# Altium project 一体板.PrjPcb
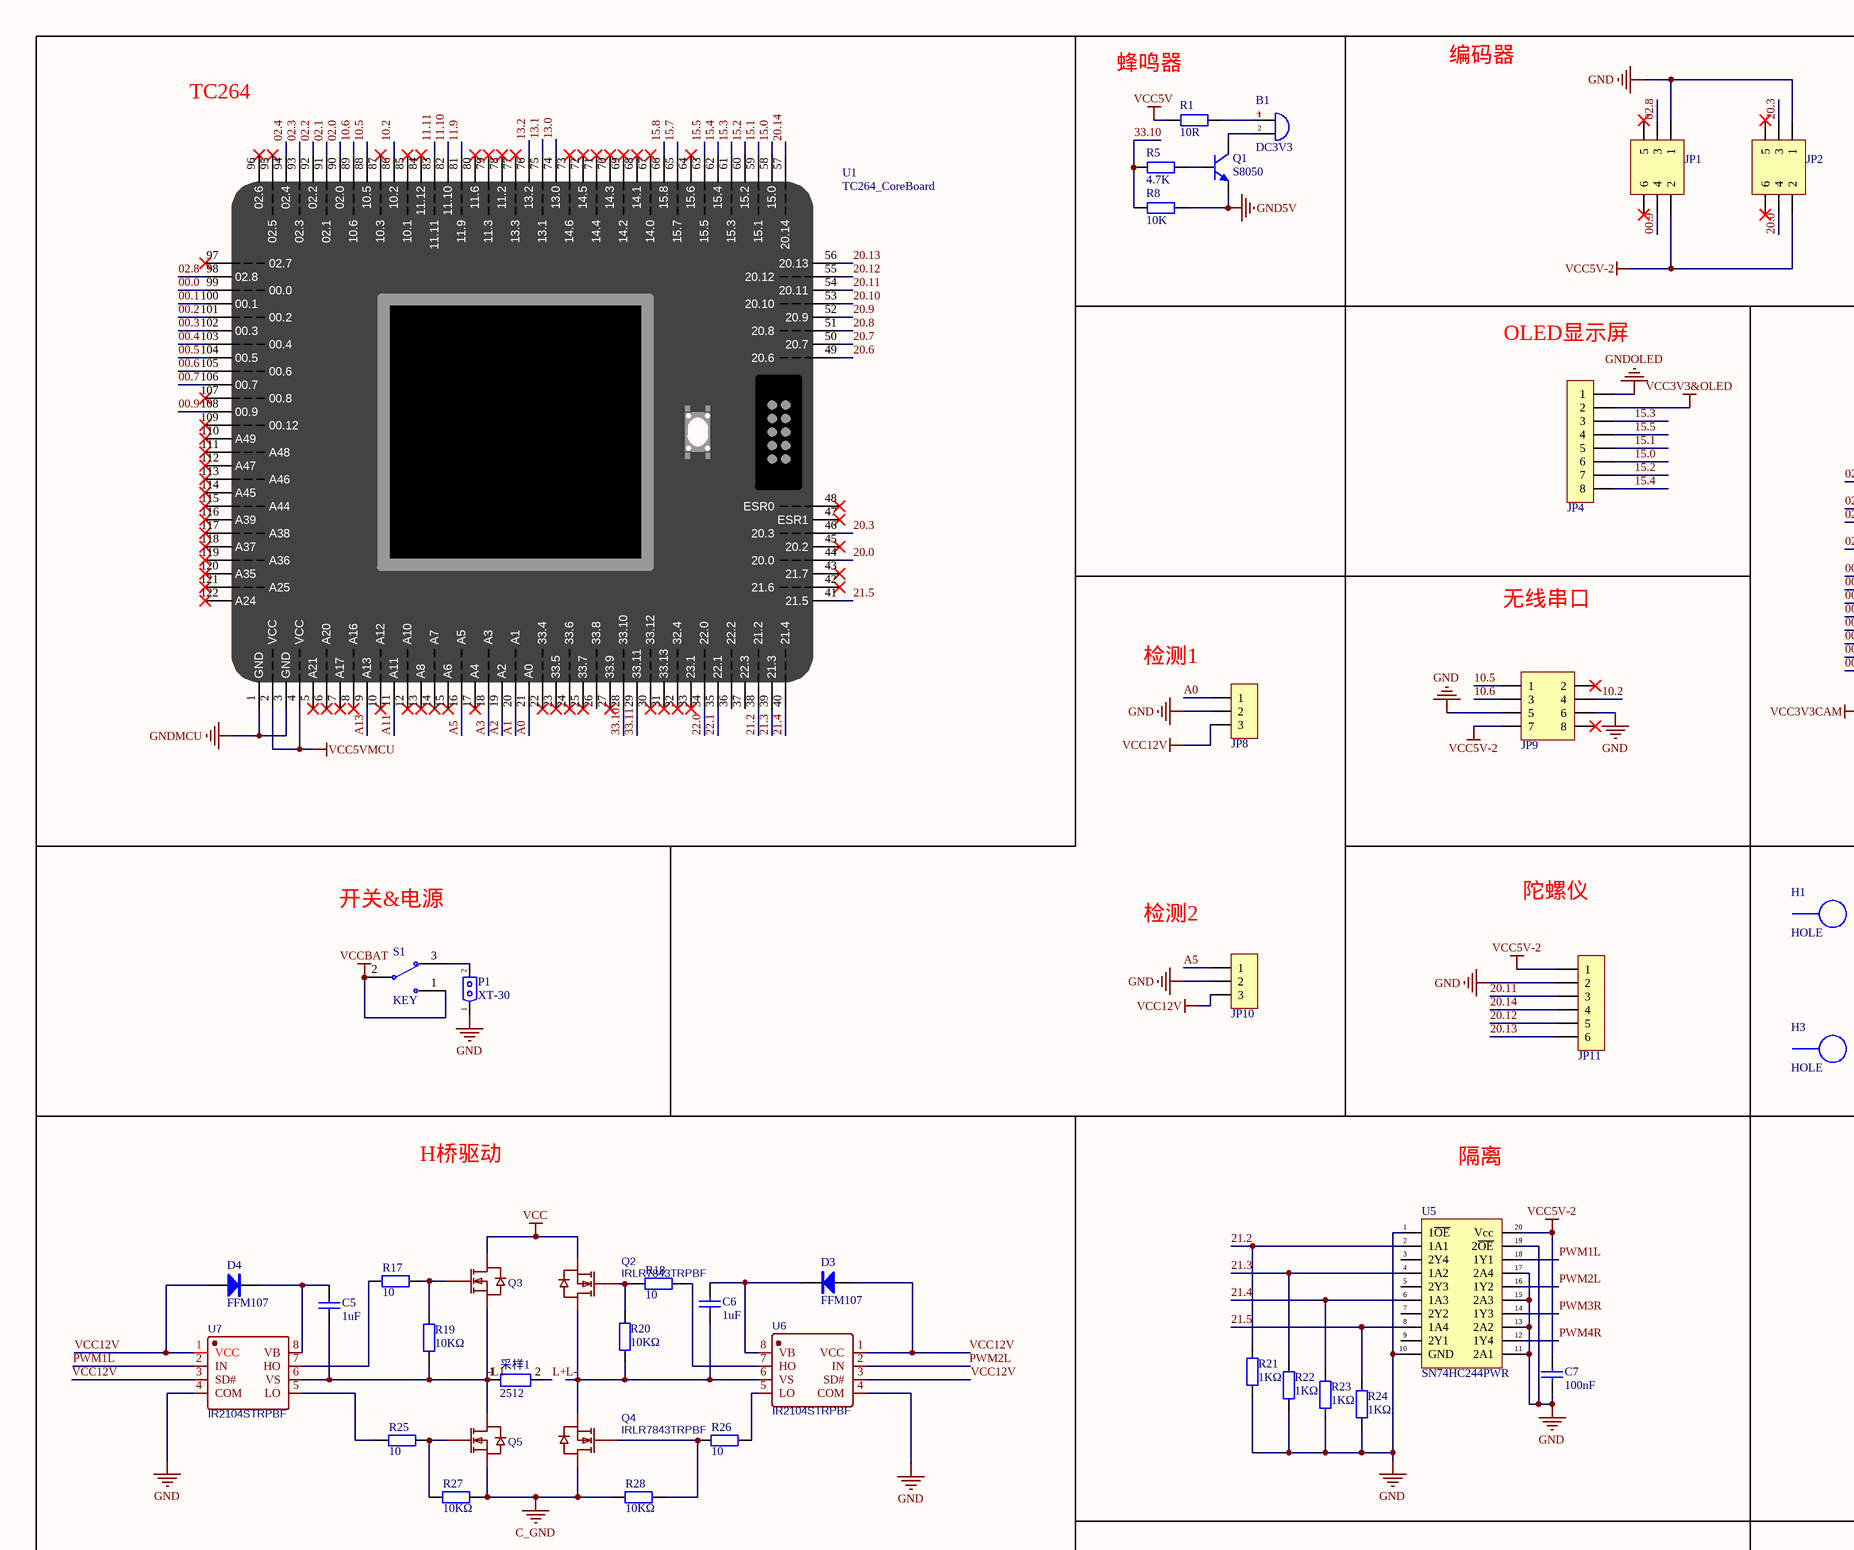
[diagram p0: 一体板.SchDoc, top left]
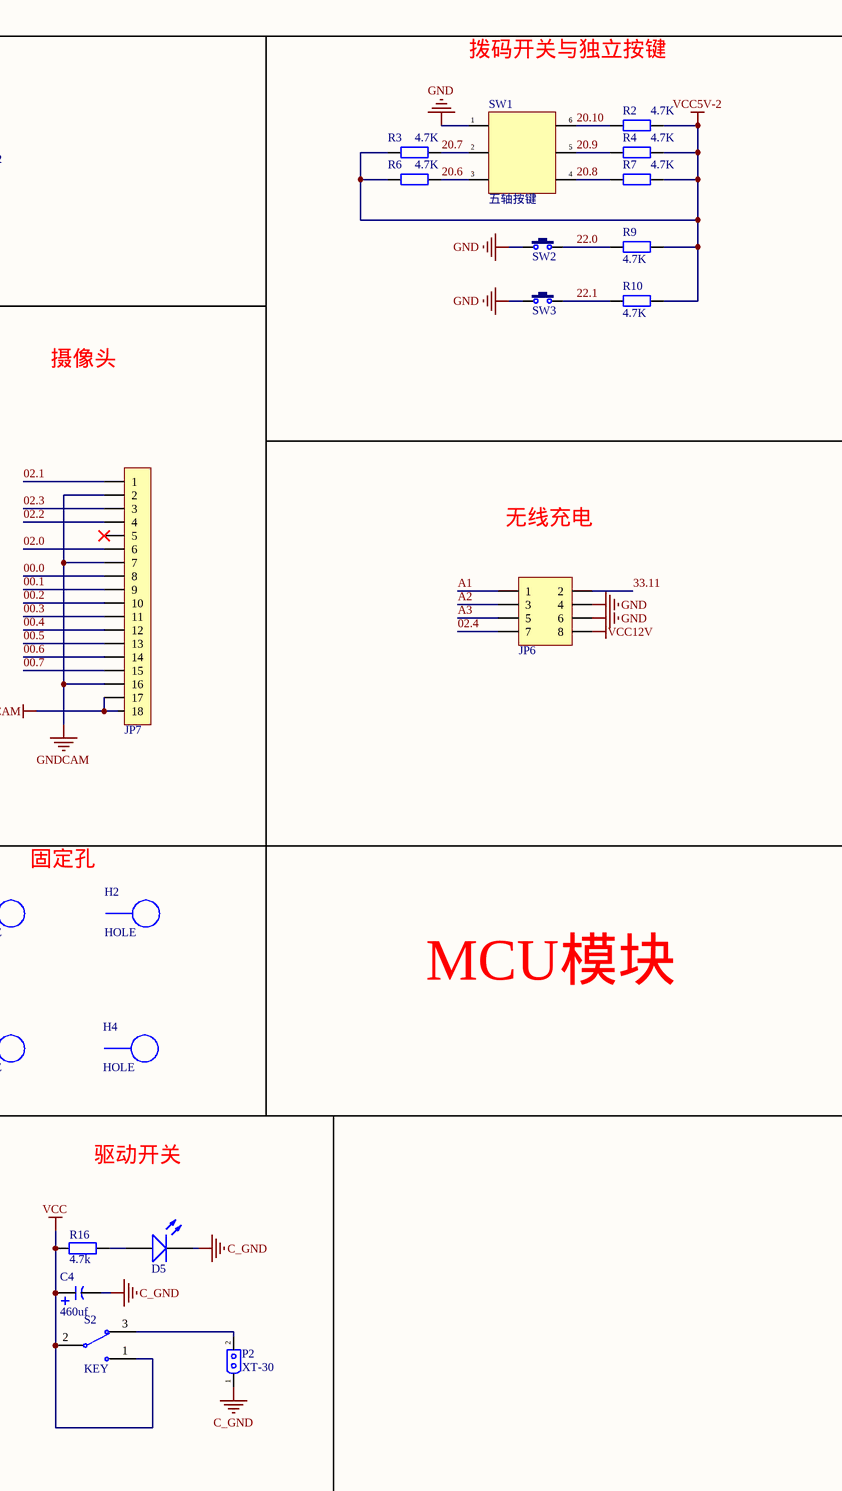
[diagram p1: 一体板.SchDoc, top middle]
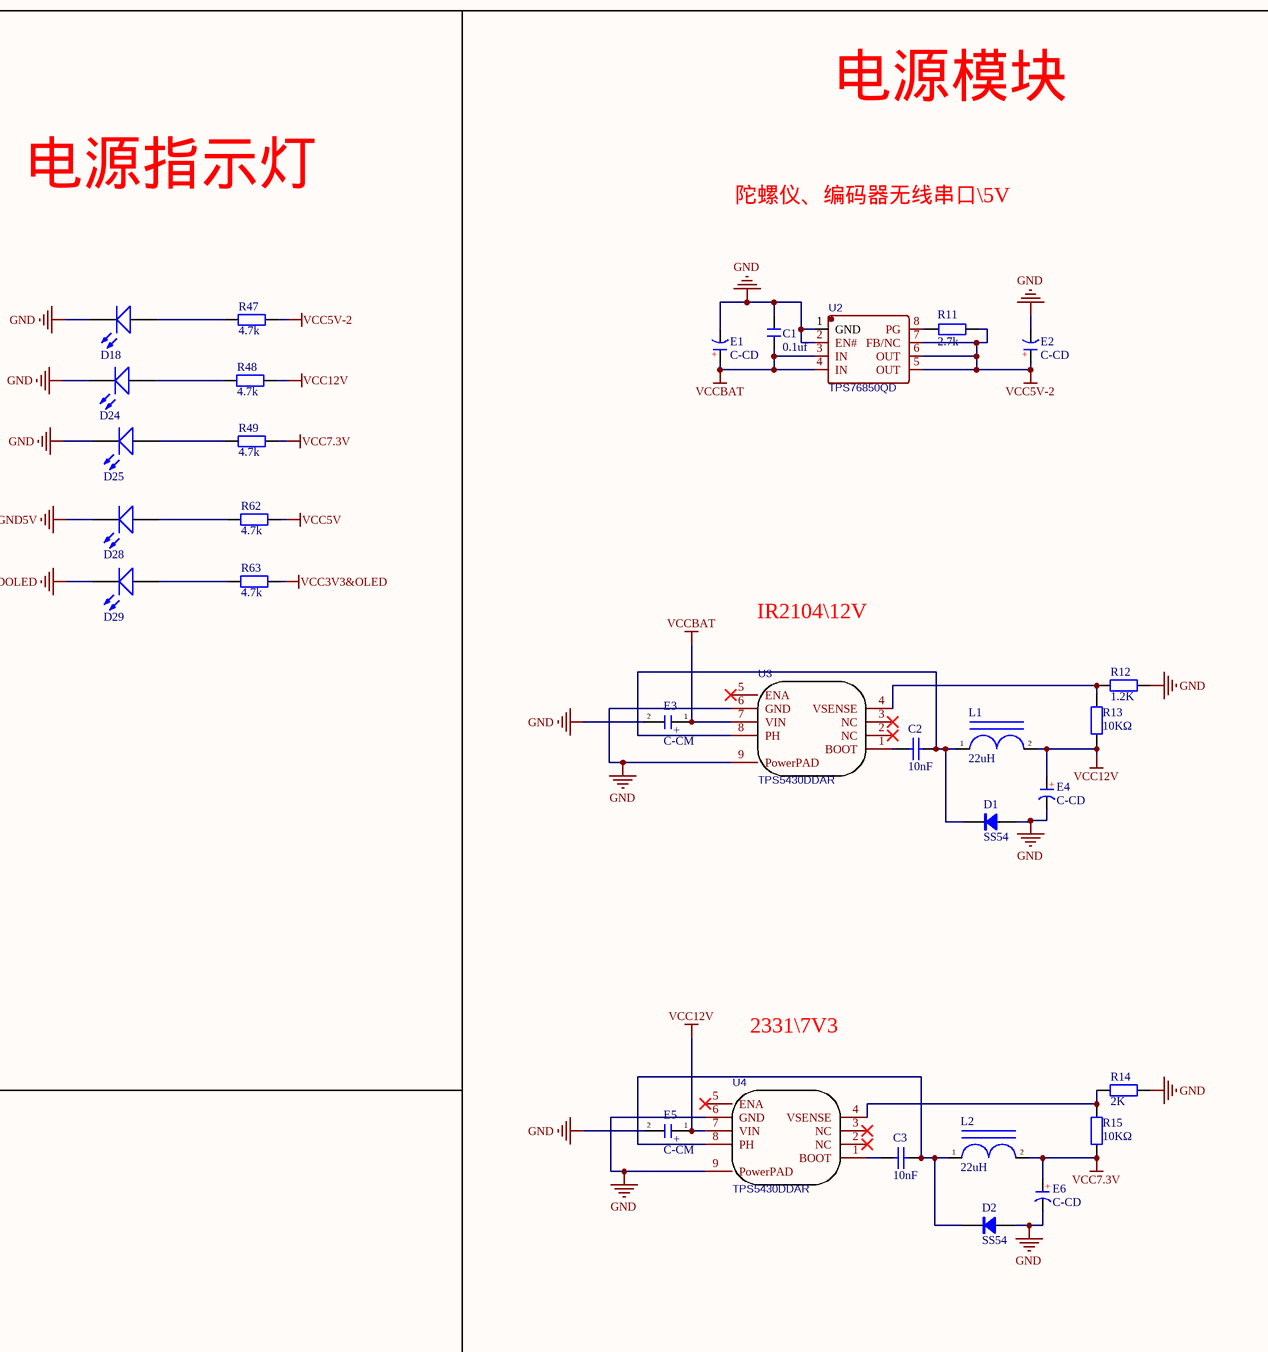
[diagram p2: 一体板.SchDoc, top right]
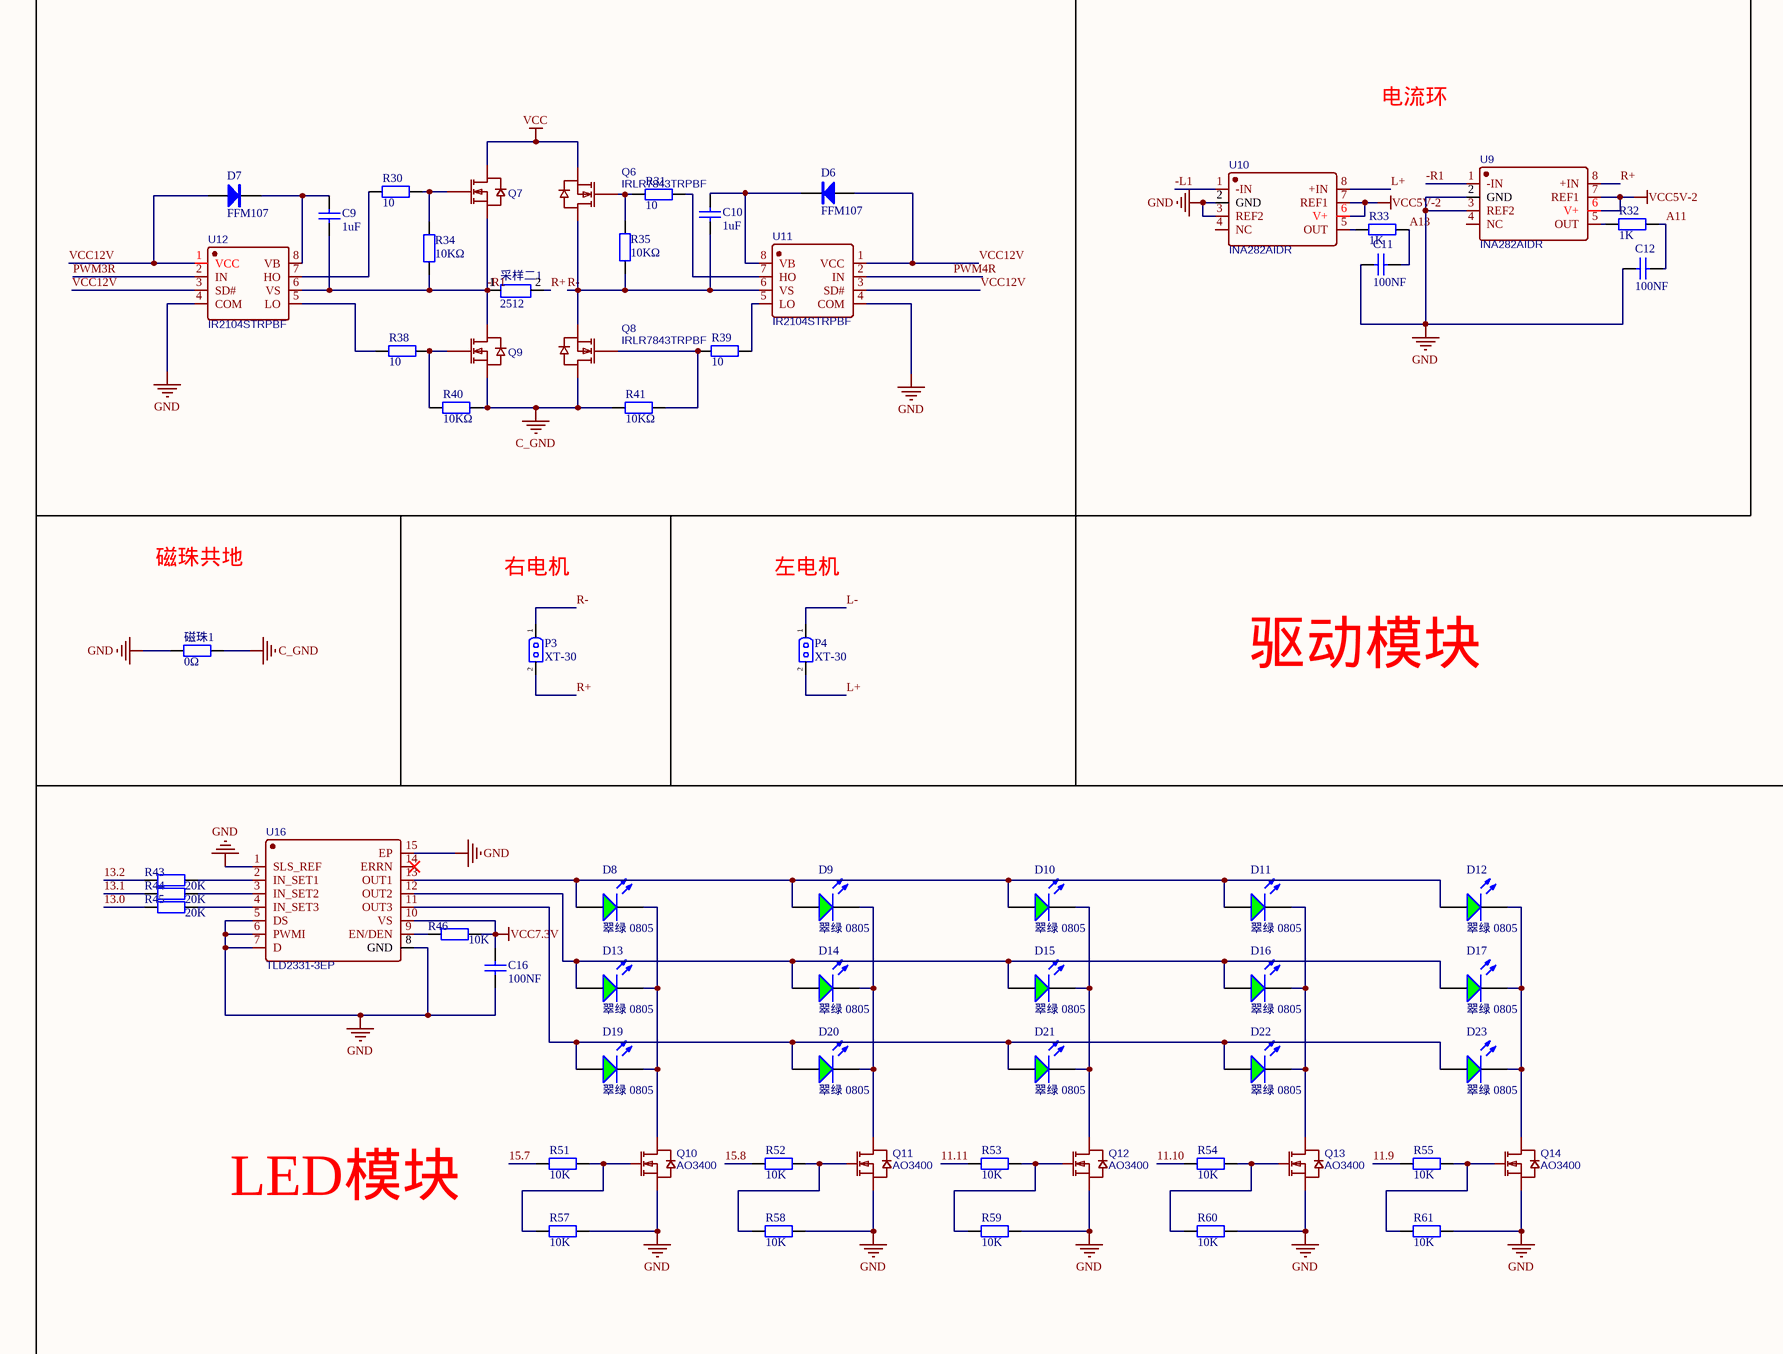
[diagram p3: 一体板.SchDoc, bottom left]
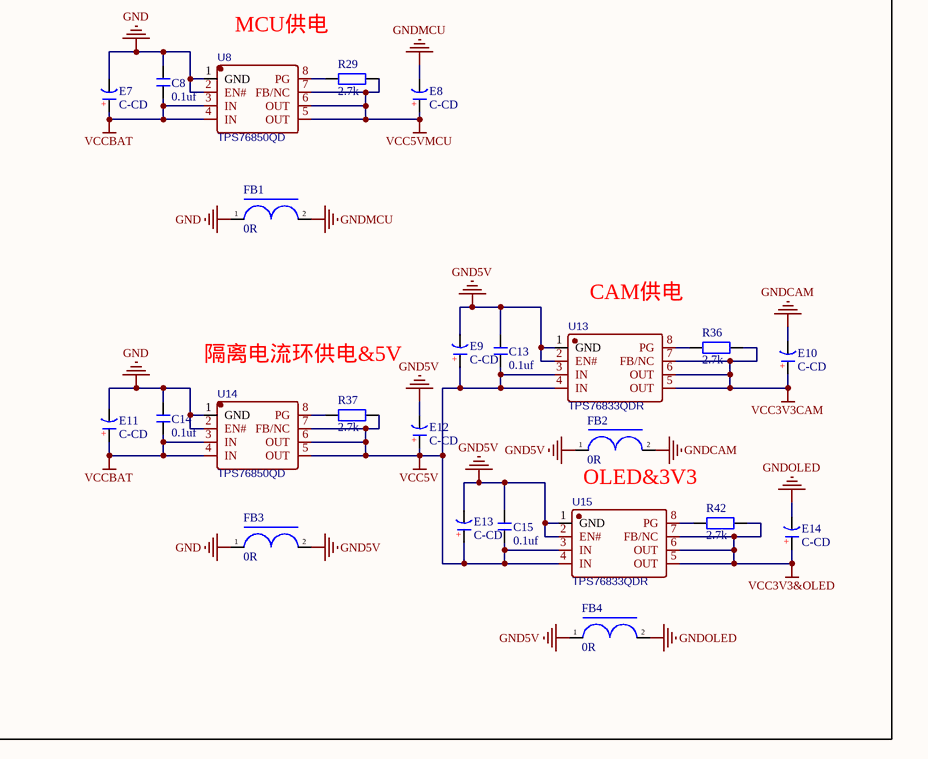
[diagram p4: 一体板.SchDoc, bottom right]
1 sheet, 180 parts. Net scope: global (net labels, ports and power ports of the same name join across sheets).

## Sheet 一体板.SchDoc
size A1; SheetNumber: 1; SheetTotal: 1

### Parts
B1  DC3V3  [BEEP 5x9x5.5]
C1  0.1uf  [C 0603_M]
C2  10nF  [0603_C]
C3  10nF  [0603_C]
C4  460uf  [铝电解]
C5  1uF  [0603_C]
C6  1uF  [0603_C]
C7  100nF  [0603_C]
C8  0.1uf  [C 0603_M]
C9  1uF  [0603_C]
C10  1uF  [0603_C]
C11  100NF  [0603_C]
C12  100NF  [0603_C]
C13  0.1uf  [C 0603_M]
C14  0.1uf  [C 0603_M]
C15  0.1uf  [C 0603_M]
C16  100NF  [0603_C]
D1  SS54  [SMA]
D2  SS54  [SMA]
D3  FFM107  [SOD-123]
D4  FFM107  [SOD-123]
D5  白灯 0603  [0603_LED_S1]  (value not drawn)
D6  FFM107  [SOD-123]
D7  FFM107  [SOD-123]
D8  翠绿 0805  [0805_LED_S1]
D9  翠绿 0805  [0805_LED_S1]
D10  翠绿 0805  [0805_LED_S1]
D11  翠绿 0805  [0805_LED_S1]
D12  翠绿 0805  [0805_LED_S1]
D13  翠绿 0805  [0805_LED_S1]
D14  翠绿 0805  [0805_LED_S1]
D15  翠绿 0805  [0805_LED_S1]
D16  翠绿 0805  [0805_LED_S1]
D17  翠绿 0805  [0805_LED_S1]
D18  白灯 0603  [0603_LED_S1]  (value not drawn)
D19  翠绿 0805  [0805_LED_S1]
D20  翠绿 0805  [0805_LED_S1]
D21  翠绿 0805  [0805_LED_S1]
D22  翠绿 0805  [0805_LED_S1]
D23  翠绿 0805  [0805_LED_S1]
D24  白灯 0603  [0603_LED_S1]  (value not drawn)
D25  白灯 0603  [0603_LED_S1]  (value not drawn)
D28  白灯 0603  [0603_LED_S1]  (value not drawn)
D29  白灯 0603  [0603_LED_S1]  (value not drawn)
E1  C-CD  [CD A(3216)]
E2  C-CD  [CD A(3216)]
E3  C-CM  [CT 6*6 - C]
E4  C-CD  [CD D(7343)]
E5  C-CM  [CT 6*6 - C]
E6  C-CD  [CD D(7343)]
E7  C-CD  [CD A(3216)]
E8  C-CD  [CD A(3216)]
E9  C-CD  [CD A(3216)]
E10  C-CD  [CD A(3216)]
E11  C-CD  [CD A(3216)]
E12  C-CD  [CD A(3216)]
E13  C-CD  [CD A(3216)]
E14  C-CD  [CD A(3216)]
FB1  0R  [FB 0805_M]
FB2  0R  [FB 0805_M]
FB3  0R  [FB 0805_M]
FB4  0R  [FB 0805_M]
H1  HOLE  [LQ_SCROW3&5MM]
H2  HOLE  [LQ_SCROW3&5MM]
H3  HOLE  [LQ_SCROW3&5MM]
H4  HOLE  [LQ_SCROW3&5MM]
JP1  Header3X2  [HDR2.54-LI-2x3P]  (value not drawn)
JP2  Header3X2  [HDR2.54-LI-2x3P]  (value not drawn)
JP4  HDR-1X8  [HDR2.54-LI-8P]  (value not drawn)
JP6  Header 4X2  [CONN-TH_A2006WV-2X4P]  (value not drawn)
JP7  FPC1.0-18P  [FPC0.5 2H-WS-18P]  (value not drawn)
JP8  HDR-1X3  [PH2.0-LI-3P]  (value not drawn)
JP9  Header 4X2  [HDR2.54-M-LS-2x4P - duplicate]  (value not drawn)
JP10  HDR-1X3  [PH2.0-LI-3P]  (value not drawn)
JP11  HDR-1X6  [HDR2.54-LI-6P]  (value not drawn)
L1  22uH  [L-SMD-0630]
L2  22uH  [L-SMD-0630]
P1  XT-30  [xt-30]
P2  XT-30  [xt-30]
P3  XT-30  [xt-30]
P4  XT-30  [xt-30]
Q1  S8050  [SOT23-3M]
Q2  IRLR7843TRPBF  [TO-252-2_L6.5-W6.1-P4.58-LS10.0-TR]
Q3  IRLR7843TRPBF  [TO-252-2_L6.5-W6.1-P4.58-LS10.0-TR]  (value not drawn)
Q4  IRLR7843TRPBF  [TO-252-2_L6.5-W6.1-P4.58-LS10.0-TR]
Q5  IRLR7843TRPBF  [TO-252-2_L6.5-W6.1-P4.58-LS10.0-TR]  (value not drawn)
Q6  IRLR7843TRPBF  [TO-252-2_L6.5-W6.1-P4.58-LS10.0-TR]
Q7  IRLR7843TRPBF  [TO-252-2_L6.5-W6.1-P4.58-LS10.0-TR]  (value not drawn)
Q8  IRLR7843TRPBF  [TO-252-2_L6.5-W6.1-P4.58-LS10.0-TR]
Q9  IRLR7843TRPBF  [TO-252-2_L6.5-W6.1-P4.58-LS10.0-TR]  (value not drawn)
Q10  AO3400  [SOT-23-3_L2.9-W1.6-P1.90-LS2.8-BR]
Q11  AO3400  [SOT-23-3_L2.9-W1.6-P1.90-LS2.8-BR]
Q12  AO3400  [SOT-23-3_L2.9-W1.6-P1.90-LS2.8-BR]
Q13  AO3400  [SOT-23-3_L2.9-W1.6-P1.90-LS2.8-BR]
Q14  AO3400  [SOT-23-3_L2.9-W1.6-P1.90-LS2.8-BR]
R1  10R  [R 0603_M]
R2  4.7K  [R 0603_M]
R3  4.7K  [R 0603_M]
R4  4.7K  [R 0603_M]
R5  4.7K  [R 0603_M]
R6  4.7K  [R 0603_M]
R7  4.7K  [R 0603_M]
R8  10K  [R 0603_M]
R9  4.7K  [R 0603_M]
R10  4.7K  [R 0603_M]
R11  2.7k  [R 0603_M]
R12  1.2K  [0603_R]
R13  10KΩ  [0603_R]
R14  2K  [0603_R]
R15  10KΩ  [0603_R]
R16  4.7k  [0603_R]
R17  10  [0603_R]
R18  10  [0603_R]
R19  10KΩ  [0603_R]
R20  10KΩ  [0603_R]
R21  1KΩ  [0603_R]
R22  1KΩ  [0603_R]
R23  1KΩ  [0603_R]
R24  1KΩ  [0603_R]
R25  10  [0603_R]
R26  10  [0603_R]
R27  10KΩ  [0603_R]
R28  10KΩ  [0603_R]
R29  2.7k  [R 0603_M]
R30  10  [0603_R]
R31  10  [0603_R]
R32  1K  [0603_R]
R33  1K  [0603_R]
R34  10KΩ  [0603_R]
R35  10KΩ  [0603_R]
R36  2.7k  [R 0603_M]
R37  2.7k  [R 0603_M]
R38  10  [0603_R]
R39  10  [0603_R]
R40  10KΩ  [0603_R]
R41  10KΩ  [0603_R]
R42  2.7k  [R 0603_M]
R43  20K  [0603_R]
R44  20K  [0603_R]
R45  20K  [0603_R]
R46  10K  [0603_R]
R47  4.7k  [0603_R]
R48  4.7k  [0603_R]
R49  4.7k  [0603_R]
R51  10K  [0603_R]
R52  10K  [0603_R]
R53  10K  [0603_R]
R54  10K  [0603_R]
R55  10K  [0603_R]
R57  10K  [0603_R]
R58  10K  [0603_R]
R59  10K  [0603_R]
R60  10K  [0603_R]
R61  10K  [0603_R]
R62  4.7k  [0603_R]
R63  4.7k  [0603_R]
S1  KEY  [MTS-102]
S2  KEY  [MTS-102]
SW1  五轴按键  [TSW 10x10x9-5Key-LS]
SW2  3x6x5  [TSW SMD-3*6*2.5 - duplicate]  (value not drawn)
SW3  3x6x5  [TSW SMD-3*6*2.5 - duplicate]  (value not drawn)
U1  TC264_CoreBoard  [TC264_CoreBoard]
U2  TPS76850QD  [SOIC-8_L4.9-W3.9-P1.27-LS6.0-BL]
U3  TPS5430DDAR  [SOIC-8_L5.0-W4.0-P1.27-LS6.0-BL-EP2.0]
U4  TPS5430DDAR  [SOIC-8_L5.0-W4.0-P1.27-LS6.0-BL-EP2.0]
U5  SN74HC244PWR  [TSSOP20_M]
U6  IR2104STRPBF  [SOIC-8_L4.9-W3.9-P1.27-LS6.0-BL]
U7  IR2104STRPBF  [SOIC-8_L4.9-W3.9-P1.27-LS6.0-BL]
U8  TPS76850QD  [SOIC-8_L4.9-W3.9-P1.27-LS6.0-BL]
U9  INA282AIDR  [SOIC-8_L4.9-W3.9-P1.27-LS6.0-BL]
U10  INA282AIDR  [SOIC-8_L4.9-W3.9-P1.27-LS6.0-BL]
U11  IR2104STRPBF  [SOIC-8_L4.9-W3.9-P1.27-LS6.0-BL]
U12  IR2104STRPBF  [SOIC-8_L4.9-W3.9-P1.27-LS6.0-BL]
U13  TPS76833QDR  [SOIC-8_L4.9-W3.9-P1.27-LS6.0-BL]
U14  TPS76850QD  [SOIC-8_L4.9-W3.9-P1.27-LS6.0-BL]
U15  TPS76833QDR  [SOIC-8_L4.9-W3.9-P1.27-LS6.0-BL]
U16  TLD2331-3EP  [PG-TSDSO-14_L4.9-W3.9-P0.65-LS6.0-BL-EP]
磁珠1  0Ω  [0805_R]
采样1  2512  [R 2512_M]
采样二1  2512  [R 2512_M]

### Nets
C_GND: C4.2 D5.K P2.1 Q4.3(S) Q5.3(S) Q8.3(S) Q9.3(S) R27.1 R28.2 R40.1 R41.2 磁珠1.2
GND: C1.1 C7.1 C8.1 C11.1 C12.1 C14.1 C16.1 D1.1(A) D2.1(A) D18.K D24.K D25.K E1.2(K) E2.2(K) E3.2 E4.2(K) E5.2 E6.2(K) E7.2(K) E11.2(K) FB1.1 FB3.1 JP1.1 JP2.1 JP6.4 JP6.6 JP8.2 JP9.5 JP9.6 JP10.2 JP11.2 P1.1 Q10.2(S) Q11.2(S) Q12.2(S) Q13.2(S) Q14.2(S) R12.1 R14.1 R21.1 R22.1 R23.1 R24.1 R57.2 R58.2 R59.2 R60.2 R61.2 SW1.1 SW2.1 SW3.1 U2.1(GND) U2.2(EN#) U3.6(GND) U3.9(PowerPAD) U4.6(GND) U4.9(PowerPAD) U5.1(1~{OE}) U5.10(GND) U5.11(2A1) U5.13(2A2) U5.15(2A3) U5.17(2A4) U5.19(2~{OE}) U6.4(COM) U7.4(COM) U8.1(GND) U8.2(EN#) U9.2(GND) U9.3(REF2) U10.2(GND) U10.3(REF2) U11.4(COM) U12.4(COM) U14.1(GND) U14.2(EN#) U16.1(SLS_REF) U16.5(DS) U16.6(PWMI) U16.7(D) U16.8(GND) U16.15(EP) 磁珠1.1
GND5V: C13.1 C15.1 D28.K E9.2(K) E12.2(K) E13.2(K) FB2.1 FB3.2 FB4.1 Q1.2(E) R8.2 U13.1(GND) U13.2(EN#) U15.1(GND) U15.2(EN#)
GNDCAM: E10.2(K) FB2.2 JP7.2 JP7.7 JP7.16
GNDMCU: E8.2(K) FB1.2 U1.1(GND) U1.3(GND)
GNDOLED: D29.K E14.2(K) FB4.2 JP4.1
VCC: C4.1 Q2.4(D) Q3.4(D) Q6.4(D) Q7.4(D) R16.1 S2.1 S2.2
VCC3V3&OLED: E14.1(A) JP4.2 R42.2 R63.1 U15.5(OUT) U15.6(OUT) U15.7(FB/NC)
VCC3V3CAM: E10.1(A) JP7.17 JP7.18 R36.2 U13.5(OUT) U13.6(OUT) U13.7(FB/NC)
VCC5V: C13.2 C15.2 E9.1(A) E12.1(A) E13.1(A) R1.1 R37.2 R62.1 U13.3(IN) U13.4(IN) U14.5(OUT) U14.6(OUT) U14.7(FB/NC) U15.3(IN) U15.4(IN)
VCC5V-2: C7.2 E2.1(A) JP1.2 JP2.2 JP9.7 JP11.1 R2.2 R3.1 R4.2 R6.1 R7.2 R9.2 R10.2 R11.2 R47.1 U2.5(OUT) U2.6(OUT) U2.7(FB/NC) U5.20(Vcc) U9.6(V+) U9.7(REF1) U10.6(V+) U10.7(REF1)
VCC5VMCU: E8.1(A) R29.2 U1.2(VCC) U1.4(VCC) U8.5(OUT) U8.6(OUT) U8.7(FB/NC)
VCC7.3V: C16.2 E6.1(A) L2.2 R15.1 R46.2 R49.1 U16.10(VS)
VCC12V: D3.1(A) D4.1(A) D6.1(A) D7.1(A) E4.1(A) E5.1 JP6.8 JP8.3 JP10.3 L1.2 R13.1 R48.1 U4.7(VIN) U6.1(VCC) U6.3(SD#) U7.1(VCC) U7.3(SD#) U11.1(VCC) U11.3(SD#) U12.1(VCC) U12.3(SD#)
VCCBAT: C1.2 C8.2 C14.2 E1.1(A) E3.1 E7.1(A) E11.1(A) S1.1 S1.2 U2.3(IN) U2.4(IN) U3.7(VIN) U8.3(IN) U8.4(IN) U14.3(IN) U14.4(IN)
00.0: JP7.8 U1.99(00.0)
00.1: JP7.9 U1.100(00.1)
00.2: JP7.10 U1.101(00.2)
00.3: JP7.11 U1.102(00.3)
00.4: JP7.12 U1.103(00.4)
00.5: JP7.13 U1.104(00.5)
00.6: JP7.14 U1.105(00.6)
00.7: JP7.15 U1.106(00.7)
00.9: JP1.4 U1.108(00.9)
02.0: JP7.6 U1.90(02.0)
02.1: JP7.1 U1.91(02.1)
02.2: JP7.4 U1.92(02.2)
02.3: JP7.3 U1.93(02.3)
02.4: JP6.7 U1.94(02.4)
02.8: JP1.3 U1.98(02.8)
10.2: JP9.4 U1.86(10.2)
10.5: JP9.1 U1.88(10.5)
10.6: JP9.3 U1.89(10.6)
11.9: R55.1 U1.81(11.9)
11.10: R54.1 U1.82(11.10)
11.11: R53.1 U1.83(11.11)
13.0: R45.1 U1.74(13.0)
13.1: R44.1 U1.75(13.1)
13.2: R43.1 U1.76(13.2)
15.0: JP4.6 U1.58(15.0)
15.1: JP4.5 U1.59(15.1)
15.2: JP4.7 U1.60(15.2)
15.3: JP4.3 U1.61(15.3)
15.4: JP4.8 U1.62(15.4)
15.5: JP4.4 U1.63(15.5)
15.7: R51.1 U1.65(15.7)
15.8: R52.1 U1.66(15.8)
20.0: JP2.4 U1.44(20.0)
20.3: JP2.3 U1.46(20.3)
20.6: R6.2 SW1.3 U1.49(20.6)
20.7: R3.2 SW1.2 U1.50(20.7)
20.8: R7.1 SW1.4 U1.51(20.8)
20.9: R4.1 SW1.5 U1.52(20.9)
20.10: R2.1 SW1.6 U1.53(20.10)
20.11: JP11.3 U1.54(20.11)
20.12: JP11.5 U1.55(20.12)
20.13: JP11.6 U1.56(20.13)
20.14: JP11.4 U1.57(20.14)
21.2: R21.2 U1.38(21.2) U5.2(1A1)
21.3: R22.2 U1.39(21.3) U5.4(1A2)
21.4: R23.2 U1.40(21.4) U5.6(1A3)
21.5: R24.2 U1.41(21.5) U5.8(1A4)
22.0: R9.1 SW2.2 U1.34(22.0)
22.1: R10.1 SW3.2 U1.35(22.1)
33.10: R5.1 R8.1 U1.28(33.10)
33.11: JP6.2 U1.29(33.11)
-L1: C5.1 Q3.3(S) Q5.4(D) R19.1 U7.6(VS) U10.1(-IN) 采样1.1
-R1: C9.1 Q7.3(S) Q9.4(D) R34.1 U9.1(-IN) U12.6(VS) 采样二1.1
A0: JP8.1 U1.21(A0)
A1: JP6.1 U1.20(A1)
A2: JP6.3 U1.19(A2)
A3: JP6.5 U1.18(A3)
A5: JP10.1 U1.16(A5)
A11: C12.2 R32.1 U1.11(A11)
A13: C11.2 R33.2 U1.9(A13)
L+: P4.2 U10.8(+IN) 采样1.2
L-: C6.2 P4.1 Q2.3(S) Q4.4(D) R20.1 U6.6(VS)
PWM1L: U5.18(1Y1) U7.2(IN)
PWM2L: U5.16(1Y2) U6.2(IN)
PWM3R: U5.14(1Y3) U12.2(IN)
PWM4R: U5.12(1Y4) U11.2(IN)
R+: P3.2 U9.8(+IN) 采样二1.2
R-: C10.2 P3.1 Q6.3(S) Q8.4(D) R35.1 U11.6(VS)
NetB1_1: B1.1 R1.2
NetB1_2: B1.2 Q1.3(C)
NetC2_1: C2.1 U3.1(BOOT)
NetC2_2: C2.2 D1.2(K) L1.1 U3.8(PH)
NetC3_1: C3.1 U4.1(BOOT)
NetC3_2: C3.2 D2.2(K) L2.1 U4.8(PH)
NetC5_2: C5.2 D4.2(K) U7.8(VB)
NetC6_1: C6.1 D3.2(K) U6.8(VB)
NetC9_2: C9.2 D7.2(K) U12.8(VB)
NetC10_1: C10.1 D6.2(K) U11.8(VB)
NetD5_A: D5.A R16.2
NetD8_A: D8.A D9.A D10.A D11.A D12.A U16.13(OUT1)
NetD8_K: D8.K D13.K D19.K Q10.3(D)
NetD9_K: D9.K D14.K D20.K Q11.3(D)
NetD10_K: D10.K D15.K D21.K Q12.3(D)
NetD11_K: D11.K D16.K D22.K Q13.3(D)
NetD12_K: D12.K D17.K D23.K Q14.3(D)
NetD13_A: D13.A D14.A D15.A D16.A D17.A U16.12(OUT2)
NetD18_A: D18.A R47.2
NetD19_A: D19.A D20.A D21.A D22.A D23.A U16.11(OUT3)
NetD24_A: D24.A R48.2
NetD25_A: D25.A R49.2
NetD28_A: D28.A R62.2
NetD29_A: D29.A R63.2
NetP1_2: P1.2 S1.3
NetP2_2: P2.2 S2.3
NetQ1_1: Q1.1(B) R5.2
NetQ2_1: Q2.1(G) R18.1 R20.2
NetQ3_1: Q3.1(G) R17.2 R19.2
NetQ4_1: Q4.1(G) R26.1 R28.1
NetQ5_1: Q5.1(G) R25.2 R27.2
NetQ6_1: Q6.1(G) R31.1 R35.2
NetQ7_1: Q7.1(G) R30.2 R34.2
NetQ8_1: Q8.1(G) R39.1 R41.1
NetQ9_1: Q9.1(G) R38.2 R40.2
NetQ10_1: Q10.1(G) R51.2 R57.1
NetQ11_1: Q11.1(G) R52.2 R58.1
NetQ12_1: Q12.1(G) R53.2 R59.1
NetQ13_1: Q13.1(G) R54.2 R60.1
NetQ14_1: Q14.1(G) R55.2 R61.1
NetR11_1: R11.1 U2.8(PG)
NetR12_2: R12.2 R13.2 U3.4(VSENSE)
NetR14_2: R14.2 R15.2 U4.4(VSENSE)
NetR17_1: R17.1 U7.7(HO)
NetR18_2: R18.2 U6.7(HO)
NetR25_1: R25.1 U7.5(LO)
NetR26_2: R26.2 U6.5(LO)
NetR29_1: R29.1 U8.8(PG)
NetR30_1: R30.1 U12.7(HO)
NetR31_2: R31.2 U11.7(HO)
NetR32_2: R32.2 U9.5(OUT)
NetR33_1: R33.1 U10.5(OUT)
NetR36_1: R36.1 U13.8(PG)
NetR37_1: R37.1 U14.8(PG)
NetR38_1: R38.1 U12.5(LO)
NetR39_2: R39.2 U11.5(LO)
NetR42_1: R42.1 U15.8(PG)
NetR43_2: R43.2 U16.2(IN_SET1)
NetR44_2: R44.2 U16.3(IN_SET2)
NetR45_2: R45.2 U16.4(IN_SET3)
NetR46_1: R46.1 U16.9(EN/DEN)

Not connected (* = marked no-connect by the designer): JP1 5* 6*; JP2 5* 6*; JP7 5*; JP9 2* 8*; U1 5(A21)* 6(A20)* 7(A17)* 8(A16)* 10(A12)* 12(A10)* 13(A8)* 14(A7)* 15(A6)* 17(A4)* 22(33.4)* 23(33.5)* 24(33.6)* 25(33.7)* 26(33.8) 27(33.9)* 30(33.12)* 31(33.13)* 32(32.4)* 33(23.1)* 36(22.2) 37(22.3) 42(21.6)* 43(21.7)* 45(20.2)* 47(ESR1)* 48(ESR0)* 64(15.6)* 67(14.0)* 68(14.1)* 69(14.2)* 70(14.3)* 71(14.4)* 72(14.5)* 73(14.6)* 77(13.3)* 78(11.2)* 79(11.3)* 80(11.6)* 84(11.12)* 85(10.1)* 87(10.3)* 95(02.5)* 96(02.6)* 97(02.7)* 107(00.8)* 109(00.12)* 110(A49)* 111(A48)* 112(A47)* 113(A46)* 114(A45)* 115(A44)* 116(A39)* 117(A38)* 118(A37)* 119(A36)* 120(A35)* 121(A25)* 122(A24)*; U3 2(NC)* 3(NC)* 5(ENA)*; U4 2(NC)* 3(NC)* 5(ENA)*; U5 3(2Y4) 5(2Y3) 7(2Y2) 9(2Y1); U9 4(NC); U10 4(NC); U16 14(ERRN)*

### Notes on the sheet
- 编码器
- 拨码开关与独立按键
- TC264
- (near R1) 蜂鸣器
- 电源模块
- 电源指示灯
- 陀螺仪、编码器无线串口\5V
- (near JP4) OLED显示屏
- 摄像头
- 无线充电
- 检测1
- 无线串口
- IR2104\12V
- (near H1) 固定孔
- (near S1) 开关&电源
- 检测2
- 陀螺仪
- MCU模块
- 2331\7V3
- H桥驱动
- 隔离
- 驱动开关
- MCU供电
- 电流环
- 隔离电流环供电&5V
- (near U13) CAM供电
- (near FB2) OLED&3V3
- 磁珠共地
- 右电机
- 左电机
- 驱动模块
- LED模块
- (in symbol BEEP) +
- (in symbol C-CD) +
- (in symbol C-CM) +

### Library data of the parts
B1 = BEEP: 蜂鸣器
C1 C8 C13-C15 = C: 无极性贴片电容; 版权归属: 源创客; 材质: X7R; BOM名称: 无极性贴片电容; 学习资源: www.ooocke.com
C2 C3 = 0603 10nF (103) 10% 50V: 贴片电容; ComponentLink1Description: 供应商链接; ComponentLink1URL: http://www.szlcsc.com/product/details_58143.html; Package: 0603; Supplier: LC; SuppliersPartNumber: C57112
C4 = 极性电容
C5 C6 C9 C10 = 0603 1uF (105) 10% 50V: 贴片电容; ComponentLink1Description: 供应商链接; ComponentLink1URL: http://www.szlcsc.com/product/details_16531.html; Package: 0603; Supplier: LC; SuppliersPartNumber: C15849
C7 = 0603 100nF (104) 10% 50V: 贴片电容; ComponentLink1Description: 供应商链接; ComponentLink1URL: http://www.szlcsc.com/product/details_15331.html; Package: 0603; Supplier: LC; SuppliersPartNumber: C14663
C11 C12 = 0603 100pF (101) 5% 50V: 贴片电容; ComponentLink1Description: 供应商链接; ComponentLink1URL: http://www.szlcsc.com/product/details_15530.html; Package: 0603; Supplier: LC; SuppliersPartNumber: C14858
C16 = 0603 1.0pF (010) 0.25pF 50V: 贴片电容; ComponentLink1Description: 供应商链接; ComponentLink1URL: http://www.szlcsc.com/product/details_24709.html; Package: 0603; Supplier: LC; SuppliersPartNumber: C23969
D1 D2 = SS54: 肖特基二极管; 版权归属: 源创客; 属性: 40V/3A; BOM名称: 肖特基二极管; 学习资源: www.ooocke.com
D3 D4 D6 D7 = FR107w: 快恢复整流二极管; BOM名称: 快恢复二极管; 版权归属: 源创客; 学习资源: www.ooocke.com
D5 D18 D24 D25 D28 D29 = 0603 白灯: 发光二极管; ComponentLink1Description: 供应商链接; ComponentLink1URL: http://www.szlcsc.com/product/details_2663.html; Package: 0603; Supplier: LC; SuppliersPartNumber: C2290
D8-D17 D19-D23 = 0805 翠绿: 发光二极管; ComponentLink1Description: 供应商链接; ComponentLink1URL: http://www.szlcsc.com/product/details_2670.html; Package: 0805; Supplier: LC; SuppliersPartNumber: C2297
E1 E2 E4 E6-E14 = C-CD: 贴片钽电容; 版权归属: 源创客; BOM名称: 贴片钽电容; 学习资源: www.ooocke.com
E3 E5 = C-CM: 贴片电解电容; 版权归属: 源创客; BOM名称: 贴片电解电容; 学习资源: www.ooocke.com
FB1-FB4 = FB: 贴片磁珠
H1-H4 = HOLE: 固定孔
JP1 JP2 = Header 3X2: 3*2P接插件; 版权归属: 源创客; BOM名称: 3*2P接插件; 学习资源: www.ooocke.com
JP4 = Header 8: 8P接插件; 版权归属: 源创客; BOM名称: 8P接插件; 学习资源: www.ooocke.com
JP6 JP9 = Header 4X2: 4*2P接插件; 版权归属: 源创客; BOM名称: 4*2P接插件; 学习资源: www.ooocke.com
JP7 = FPC-18P: FPC连接器; 版权归属: 源创客; BOM名称: FPC连接器; 学习资源: www.ooocke.com
JP8 JP10 = Header 3    2.54: 3P接插件; 版权归属: 源创客; BOM名称: 3P接插件; 学习资源: www.ooocke.com
JP11 = Header 6: 6P接插件; 版权归属: 源创客; BOM名称: 6P接插件; 学习资源: www.ooocke.com
L1 L2 = L: 一体化成型电感
P1-P4 = XT-30: 接口
Q1 = 8050-SMD: 高频放大-NPN型; 版权归属: 源创客; 属性: 40V 1.5A 1W 100MHZ; BOM名称: 高频放大-NPN型; 学习资源: www.ooocke.com
Q2 Q4 Q6 Q8 = IRLR7843TRPBFAN: BOM_Manufacturer: IR; BOM_Supplier: LCSC; BOM_Manufacturer Part: IRLR7843TRPBF; BOM_Supplier Part: C21988; BOM_JLCPCB Part Class: Extended Part; spicePre: Q; spiceSymbolName: IRLR7843TRPBF
Q3 Q5 Q7 Q9 = IRLR7843TRPBF: BOM_Manufacturer: IR; BOM_Supplier: LCSC; BOM_Manufacturer Part: IRLR7843TRPBF; BOM_Supplier Part: C21988; BOM_JLCPCB Part Class: Extended Part; spicePre: Q; spiceSymbolName: IRLR7843TRPBF
Q10-Q14 = AO3400_C2890121: BOM_Manufacturer: TECH PUBLIC(台舟); Contributor: LCSC; BOM_Supplier: LCSC; BOM_Supplier Part: C2890121; BOM_Manufacturer Part: AO3400; BOM_JLCPCB Part Class: Extended Part; spicePre: Q; spiceSymbolName: AO3400_C2890121
R1-R11 R29 R36 R37 R42 = RES: 精密贴片电阻; BOM名称: 精密电阻; 版权归属: 源创客; 学习资源: www.ooocke.com
R12-R15 = 0603 1.5KΩ (1501) 1%: 贴片电阻; ComponentLink1Description: 供应商链接; ComponentLink1URL: http://www.szlcsc.com/product/details_23570.html; Package: 0603; Supplier: LC; SuppliersPartNumber: C22843
R16 R43-R49 R51-R55 R57-R63 = 0603 0Ω (0R0) 1%: 贴片电阻; ComponentLink1Description: 供应商链接; ComponentLink1URL: http://www.szlcsc.com/product/details_21903.html; Package: 0603; Supplier: LC; SuppliersPartNumber: C21189
R17 R18 R25 R26 R30 R31 R38 R39 = 0603 1.1KΩ (1101) 1%: 贴片电阻; ComponentLink1Description: 供应商链接; ComponentLink1URL: http://www.szlcsc.com/product/details_23491.html; Package: 0603; Supplier: LC; SuppliersPartNumber: C22764
R19 R20 R27 R28 R34 R35 R40 R41 = 0603 10KΩ (1002) 1%: 贴片电阻; ComponentLink1Description: 供应商链接; ComponentLink1URL: http://www.szlcsc.com/product/details_26547.html; Package: 0603; Supplier: LC; SuppliersPartNumber: C25804
R21-R24 = 0603 1KΩ (1001) 1%: 贴片电阻; ComponentLink1Description: 供应商链接; ComponentLink1URL: http://www.szlcsc.com/product/details_21904.html; Package: 0603; Supplier: LC; SuppliersPartNumber: C21190
R32 R33 = 0603 10MΩ (1005) 1%: 贴片电阻; ComponentLink1Description: 供应商链接; ComponentLink1URL: http://www.szlcsc.com/product/details_7726.html; Package: 0603; Supplier: LC; SuppliersPartNumber: C7250
S1 S2 = MTS-102: 开关
SW1 = TSW 5KEY
SW2 SW3 = TSW 3x6: 3x6轻触开关; 版权归属: 源创客; BOM名称: 3x6轻触开关; 学习资源: www.ooocke.com
U1 = TC264_CoreBoard: 逐飞科技TC264核心板
U2 U8 U14 = TPS76850QD: BOM_Manufacturer: Texas Instruments; Contributor: LCSC; BOM_Supplier: LCSC; BOM_Supplier Part: C194763; BOM_Manufacturer Part: TPS76850QD; BOM_JLCPCB Part Class: Extended Part; spicePre: U; spiceSymbolName: TPS76850QD
U3 U4 = TPS5430DDAR_1: BOM_Manufacturer: TI; BOM_Supplier: LCSC; BOM_Manufacturer Part: TPS5430DDAR; BOM_Supplier Part: C9864; BOM_JLCPCB Part Class: Basic Part; spicePre: U; spiceSymbolName: TPS5430DDAR
U5 = SN74HC244PWR: IC
U6 U11 = IR2104fan: BOM_Manufacturer: IR; spicePre: X; BOM_Supplier: LCSC; BOM_Manufacturer Part: IR2104STRPBF; BOM_Supplier Part: C2960; BOM_JLCPCB Part Class: Extended Part; spiceSymbolName: IR2104STRPBF
U7 U12 = IR2104STRPBF: BOM_Manufacturer: IR; spicePre: X; BOM_Supplier: LCSC; BOM_Manufacturer Part: IR2104STRPBF; BOM_Supplier Part: C2960; BOM_JLCPCB Part Class: Extended Part; spiceSymbolName: IR2104STRPBF
U9 U10 = INA282AIDR: BOM_Manufacturer: TI; spicePre: X; BOM_Supplier Part: C53319; BOM_Supplier: LCSC; BOM_Manufacturer Part: INA282AIDR; BOM_JLCPCB Part Class: Extended Part; spiceSymbolName: INA282AIDR
U13 U15 = TPS76833QDR: BOM_Manufacturer: TI; BOM_Supplier: LCSC; BOM_Manufacturer Part: TPS76833QDR; BOM_Supplier Part: C16002; BOM_JLCPCB Part Class: Extended Part; spicePre: U; spiceSymbolName: TPS76833QDR
U16 = TLD2331-3EP: BOM_Manufacturer: Infineon(英飞凌); Contributor: LCSC; BOM_Supplier: LCSC; BOM_Supplier Part: C539647; BOM_Manufacturer Part: TLD2331-3EP; Frequency: -; BOM_JLCPCB Part Class: Extended Part; spicePre: U; spiceSymbolName: TLD2331-3EP
磁珠1 = 0805 0Ω (0R0) 1%: 贴片电阻; ComponentLink1Description: 供应商链接; ComponentLink1URL: http://www.szlcsc.com/product/details_18165.html; Package: 0805; Supplier: LC; SuppliersPartNumber: C17477